# EAGLE design tranc_2b (EAGLE 6.5.0)
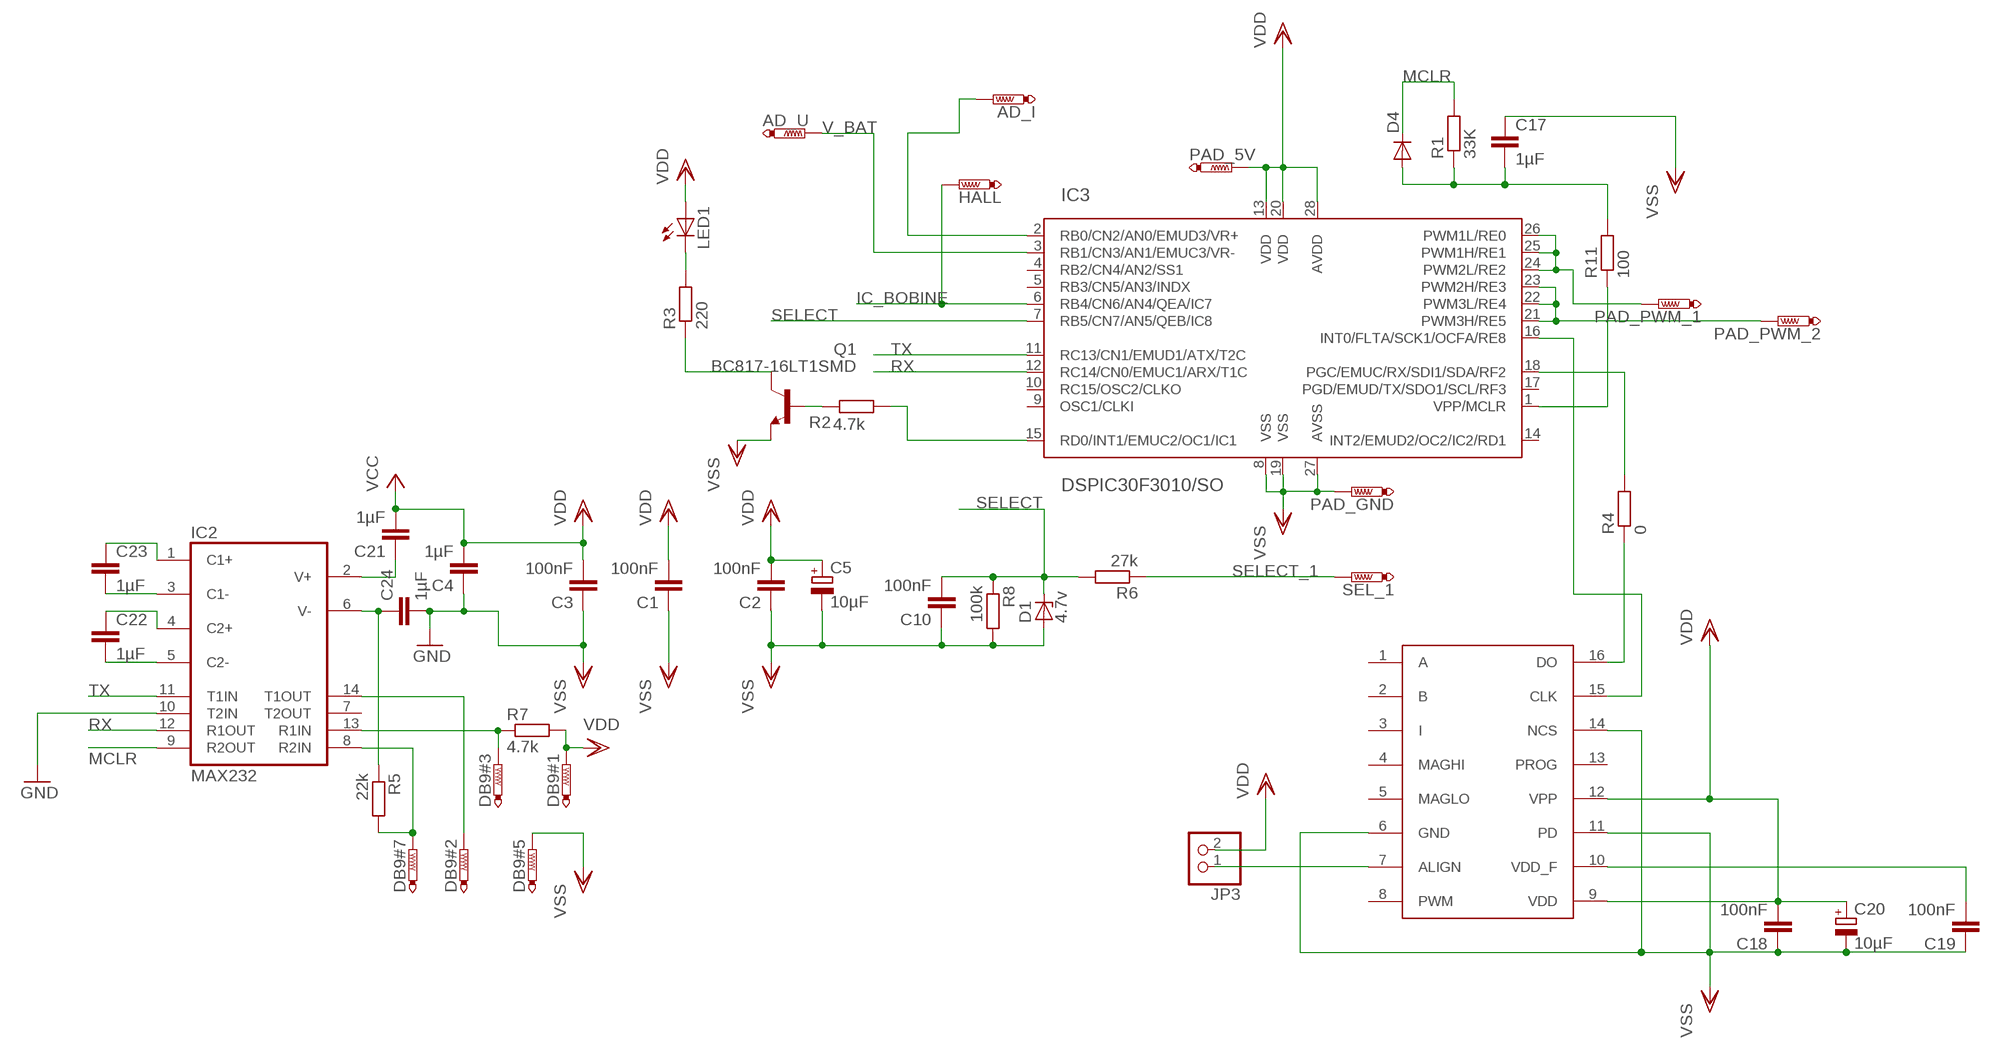
[diagram p0: schematic, sheet 1]

## Parts
AD_I  PTR1TP20SQ  [TP20SQ]
AD_U  PTR1TP20SQ  [TP20SQ]
C1  100nF  C-EUC0805K  [C0805K]
C2  100nF  C-EUC0805K  [C0805K]
C3  100nF  C-EUC0805K  [C0805K]
C4  1µF  C-EUC0805K  [C0805K]
C5  10µF  CPOL-EUSMCB  [SMC_B]
C10  100nF  C-EUC0805K  [C0805K]
C17  1µF  C-EUC0805K  [C0805K]
C18  100nF  C-EUC0805K  [C0805K]
C19  100nF  C-EUC0805K  [C0805K]
C20  10µF  CPOL-EUSMCB  [SMC_B]
C21  1µF  C-EUC0805K  [C0805K]
C22  1µF  C-EUC0805K  [C0805K]
C23  1µF  C-EUC0805K  [C0805K]
C24  1µF  C-EUC0805K  [C0805K]
D1  4.7v  ZENER-DIODESOD80C  [SOD80C]
D4  DIODE-MINIMELF  [MINIMELF]
DB9#1  PTR1TP20SQ  [TP20SQ]
DB9#2  PTR1TP20SQ  [TP20SQ]
DB9#3  PTR1TP20SQ  [TP20SQ]
DB9#5  PTR1TP20SQ  [TP20SQ]
DB9#7  PTR1TP20SQ  [TP20SQ]
HALL  PTR1TP20SQ  [TP20SQ]
IC2  MAX232  [SO16]
IC3  DSPIC30F3010/SO  [SO-28W]
JP3  PINHD-1X2  [1X02]
LED1  LEDCHIPLED_1206  [CHIPLED_1206]
PAD_5V  PTR1TP20SQ  [TP20SQ]
PAD_GND  PTR1TP20SQ  [TP20SQ]
PAD_PWM_1  PTR1TP20SQ  [TP20SQ]
PAD_PWM_2  PTR1TP20SQ  [TP20SQ]
Q1  BC817-16LT1SMD  [SOT23-BEC]
R1  33K  R-EU_M0805  [M0805]
R2  4.7k  R-EU_M0805  [M0805]
R3  220  R-EU_M0805  [M0805]
R4  0  R-EU_R0805W  [R0805W]
R5  22k  R-EU_M0805  [M0805]
R6  27k  R-EU_M0805  [M0805]
R7  4.7k  R-EU_M0805  [M0805]
R8  100k  R-EU_M0805  [M0805]
R11  100  R-EU_M0805  [M0805]
SEL_1  PTR1TP20SQ  [TP20SQ]
U$3  AVAGO_AEAT-6600TSSOP16  [AVAGO_TSSOP16]

## Nets
IC_BOBINE: HALL.TP IC3.6(RB4/CN6/AN4/QEA/IC7)
MCLR: D4.C IC2.9(R2OUT) R1.2
MCLR1: IC3.1(VPP/MCLR) R11.1
N$1: R4.1 U$3.16(DO)
N$2: IC3.24(PWM2L/RE2) IC3.25(PWM1H/RE1) IC3.26(PWM1L/RE0) PAD_PWM_1.TP
N$3: IC3.16(INT0/FLTA/SCK1/OCFA/RE8) U$3.15(CLK)
N$4: IC3.21(PWM3H/RE5) IC3.22(PWM3L/RE4) IC3.23(PWM2H/RE3) PAD_PWM_2.TP
N$5: Q1.B R2.2
N$6: Q1.C R3.1
N$7: IC3.15(RD0/INT1/EMUC2/OC1/IC1) R2.1
N$9: C17.2 D4.A R1.1 R11.2
N$10: C21.1 IC2.2(V+)
N$14: JP3.1 U$3.7(ALIGN)
N$17: IC3.18(PGC/EMUC/RX/SDI1/SDA/RF2) R4.2
N$23: LED1.C R3.2
N$27: C23.1 IC2.1(C1+)
N$28: C23.2 IC2.3(C1-)
N$29: C22.2 IC2.5(C2-)
N$30: AD_I.TP IC3.2(RB0/CN2/AN0/EMUD3/VR+)
N$31: C19.2 U$3.10(VDD_F)
N$32: C22.1 IC2.4(C2+)
N$34: C24.1 IC2.6(V-) R5.1
N$35: DB9#3.TP IC2.13(R1IN) R7.1
N$36: DB9#2.TP IC2.14(T1OUT)
N$37: DB9#7.TP IC2.8(R2IN) R5.2
RX: IC2.12(R1OUT) IC3.12(RC14/CN0/EMUC1/ARX/T1C)
SELECT: C10.2 D1.C IC3.7(RB5/CN7/AN5/QEB/IC8) R6.2 R8.1
SELECT_1: R6.1 SEL_1.TP
TX: IC2.11(T1IN) IC3.11(RC13/CN1/EMUD1/ATX/T2C)
V_BAT: AD_U.TP IC3.3(RB1/CN3/AN1/EMUC3/VR-)
VDD: C1.2 C2.2 C3.2 C4.2 C5.+ C18.2 C20.+ C21.2 DB9#1.TP IC3.13(VDD) IC3.20(VDD) IC3.28(AVDD) JP3.2 LED1.A PAD_5V.TP R7.2 U$3.9(VDD) U$3.12(VPP) ; supply symbol labelled VCC
VSS: C1.1 C2.1 C3.1 C4.1 C5.- C10.1 C17.1 C18.1 C19.1 C20.- C24.2 D1.A DB9#5.TP IC2.10(T2IN) IC3.8(VSS) IC3.19(VSS) IC3.27(AVSS) PAD_GND.TP Q1.E R8.2 U$3.6(GND) U$3.11(PD) U$3.14(NCS) ; supply symbol labelled GND
Unconnected: IC2.7(T2OUT) IC3.4(RB2/CN4/AN2/SS1) IC3.5(RB3/CN5/AN3/INDX) IC3.9(OSC1/CLKI) IC3.10(RC15/OSC2/CLKO) IC3.14(INT2/EMUD2/OC2/IC2/RD1) IC3.17(PGD/EMUD/TX/SDO1/SCL/RF3) U$3.1(A) U$3.2(B) U$3.3(I) U$3.4(MAGHI) U$3.5(MAGLO) U$3.8(PWM) U$3.13(PROG)

## Power pins joined to a net without a drawn wire
VDD: IC2.16(VCC)
VSS: IC2.15(GND)

## Library data of the parts
AD_I AD_U DB9#1-DB9#3 DB9#5 DB9#7 HALL PAD_5V PAD_GND PAD_PWM_1 PAD_PWM_2 SEL_1 = testpad:PTR1: TEST PIN
C1-C4 C10 C17-C19 C21-C24 = rcl:C-EU: CAPACITOR, European symbol
C5 C20 = rcl:CPOL-EU: POLARIZED CAPACITOR, European symbol
D1 = diode:ZENER-DIODE: Z-Diode
D4 = diode:DIODE-: DIODE
IC2 = maxim:MAX232: RS232 TRANSCEIVER
IC3 = microchip-dspic:DSPIC30F3010: dsPIC Motion Controller DSC
JP3 = pinhead:PINHD-1X2: PIN HEADER
LED1 = led:LED: LED OSRAM: - CHIPLED LG R971, LG N971, LY N971, LG Q971, LY Q971, LO R971, LY R971 LH N974, LH R974 LS Q976, LO Q976, LY Q976 LO Q996 - Hyper CHIPLED LW Q18S LB Q993, LB Q99A, LB R99A - SideLED LS A670, LO A670, LY A670, LG A670, LP A670 LB A673, LV A673, LT A673, LW A673 LH A674 LY A675 LS A676, LA A676, LO A676, LY A676, LW A676 LS A679, LY A679, LG A679 - Hyper Micro SIDELED® LS Y876, LA Y876, LO Y876, LY Y876 LT Y87S - SmartLED LW L88C, LW L88S LB L89C, LB L89S, LG L890 LS L89K, LO L89K, LY L89K LS L896, LA L896, LO L896, LY L896 - TOPLED LS T670, LO T670, LY T670, LG T670, LP T670 LSG T670, LSP T670, LSY T670, LOP T670, LYG T670 LG T671, LOG T671, LSG T671 LB T673, LV T673, LT T673, LW T673 LH T674 LS T676, LA T676, LO T676, LY T676, LB T676, LH T676, LSB T676, LW T676 LB T67C, LV T67C, LT T67C, LS T67K, LO T67K, LY T67K, LW E67C LS E67B, LA E67B, LO E67B, LY E67B, LB E67C, LV E67C, LT E67C LW T67C LS T679, LY T679, LG T679 LS T770, LO T770, LY T770, LG T770, LP T770 LB T773, LV T773, LT T773, LW T773 LH T774 LS E675, LA E675, LY E675, LS T675 LS T776, LA T776, LO T776, LY T776, LB T776 LHGB T686 LT T68C, LB T68C - Hyper Mini TOPLED® LB M676 - Mini TOPLED Santana® LG M470 LS M47K, LO M47K, LY M47K Source: http://www.osram.convergy.de LUXEON: - LUMILED® LXK2-PW12-R00, LXK2-PW12-S00, LXK2-PW14-U00, LXK2-PW14-V00 LXK2-PM12-R00, LXK2-PM12-S00, LXK2-PM14-U00 LXK2-PE12-Q00, LXK2-PE12-R00, LXK2-PE12-S00, LXK2-PE14-T00, LXK2-PE14-U00 LXK2-PB12-K00, LXK2-PB12-L00, LXK2-PB12-M00, LXK2-PB14-N00, LXK2-PB14-P00, LXK2-PB14-Q00 LXK2-PR12-L00, LXK2-PR12-M00, LXK2-PR14-Q00, LXK2-PR14-R00 LXK2-PD12-Q00, LXK2-PD12-R00, LXK2-PD12-S00 LXK2-PH12-R00, LXK2-PH12-S00 LXK2-PL12-P00, LXK2-PL12-Q00, LXK2-PL12-R00 Source: www.luxeon.com KINGBRIGHT: KA-3528ASYC Source: www.kingbright.com
Q1 = transistor-npn:BC817*: NPN Transistor
R1-R8 R11 = rcl:R-EU_: RESISTOR, European symbol
U$3 = aeat_6600_1:AVAGO_AEAT-6600

## Board
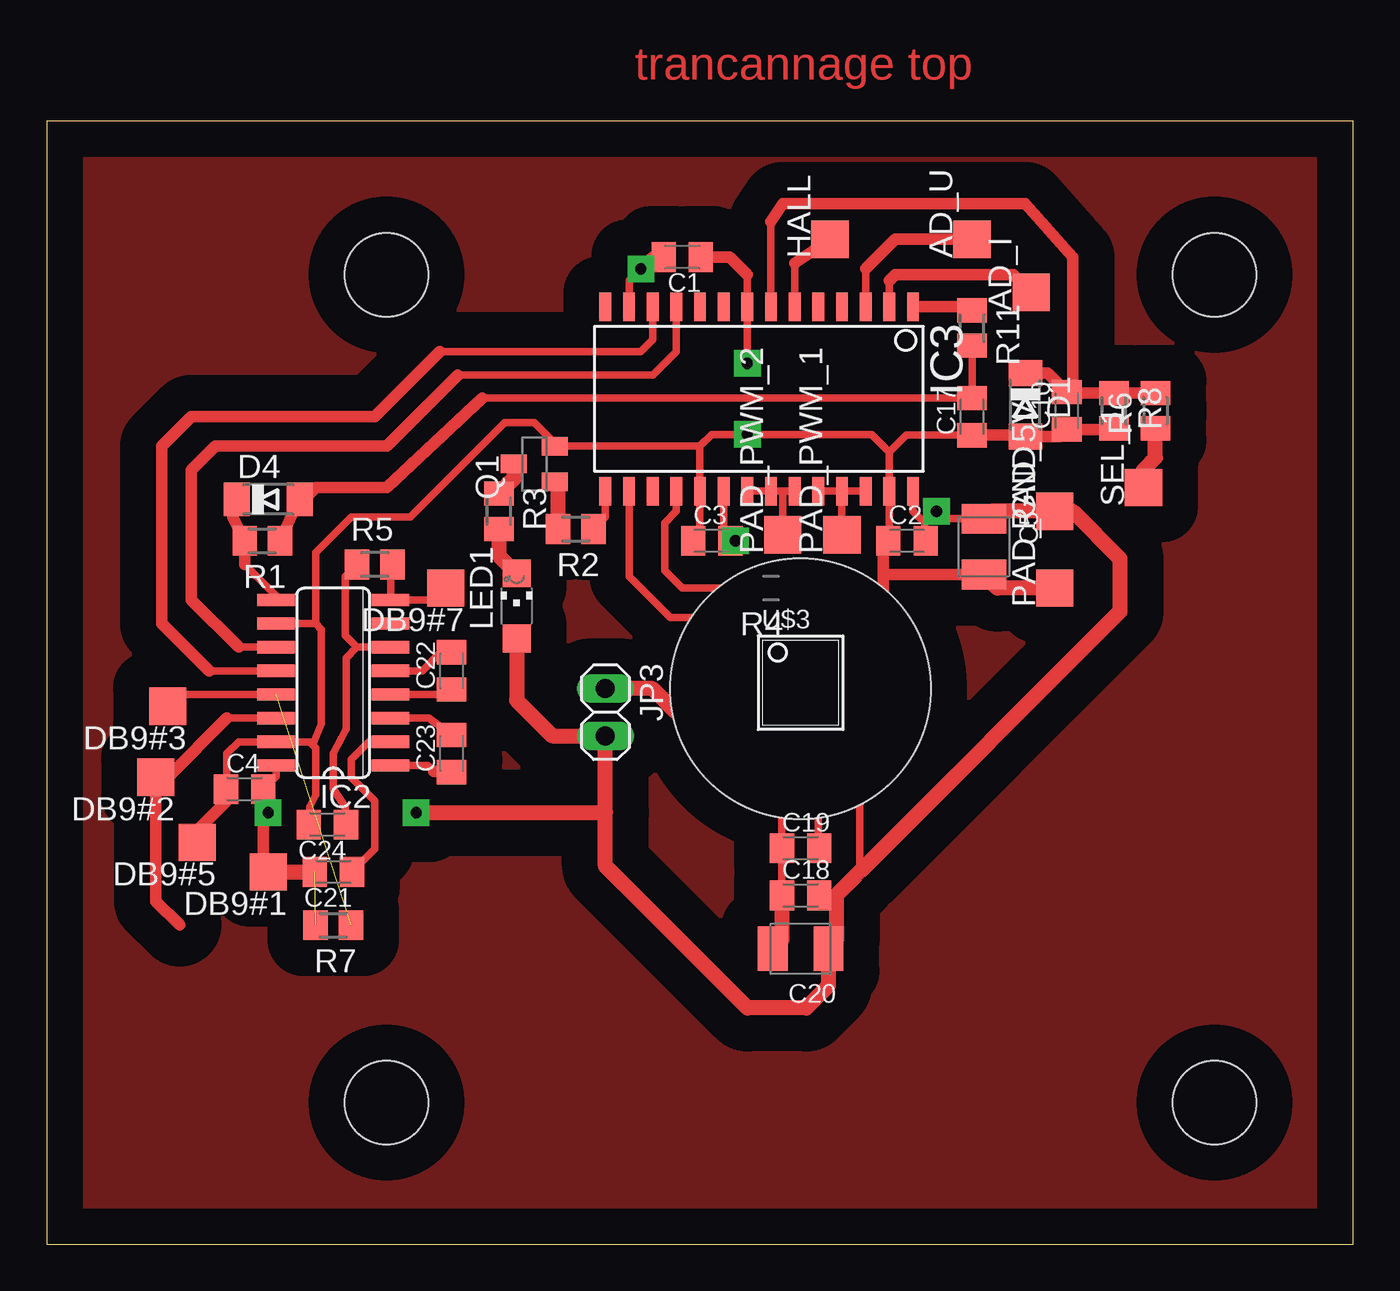
[diagram p1: board, top side]
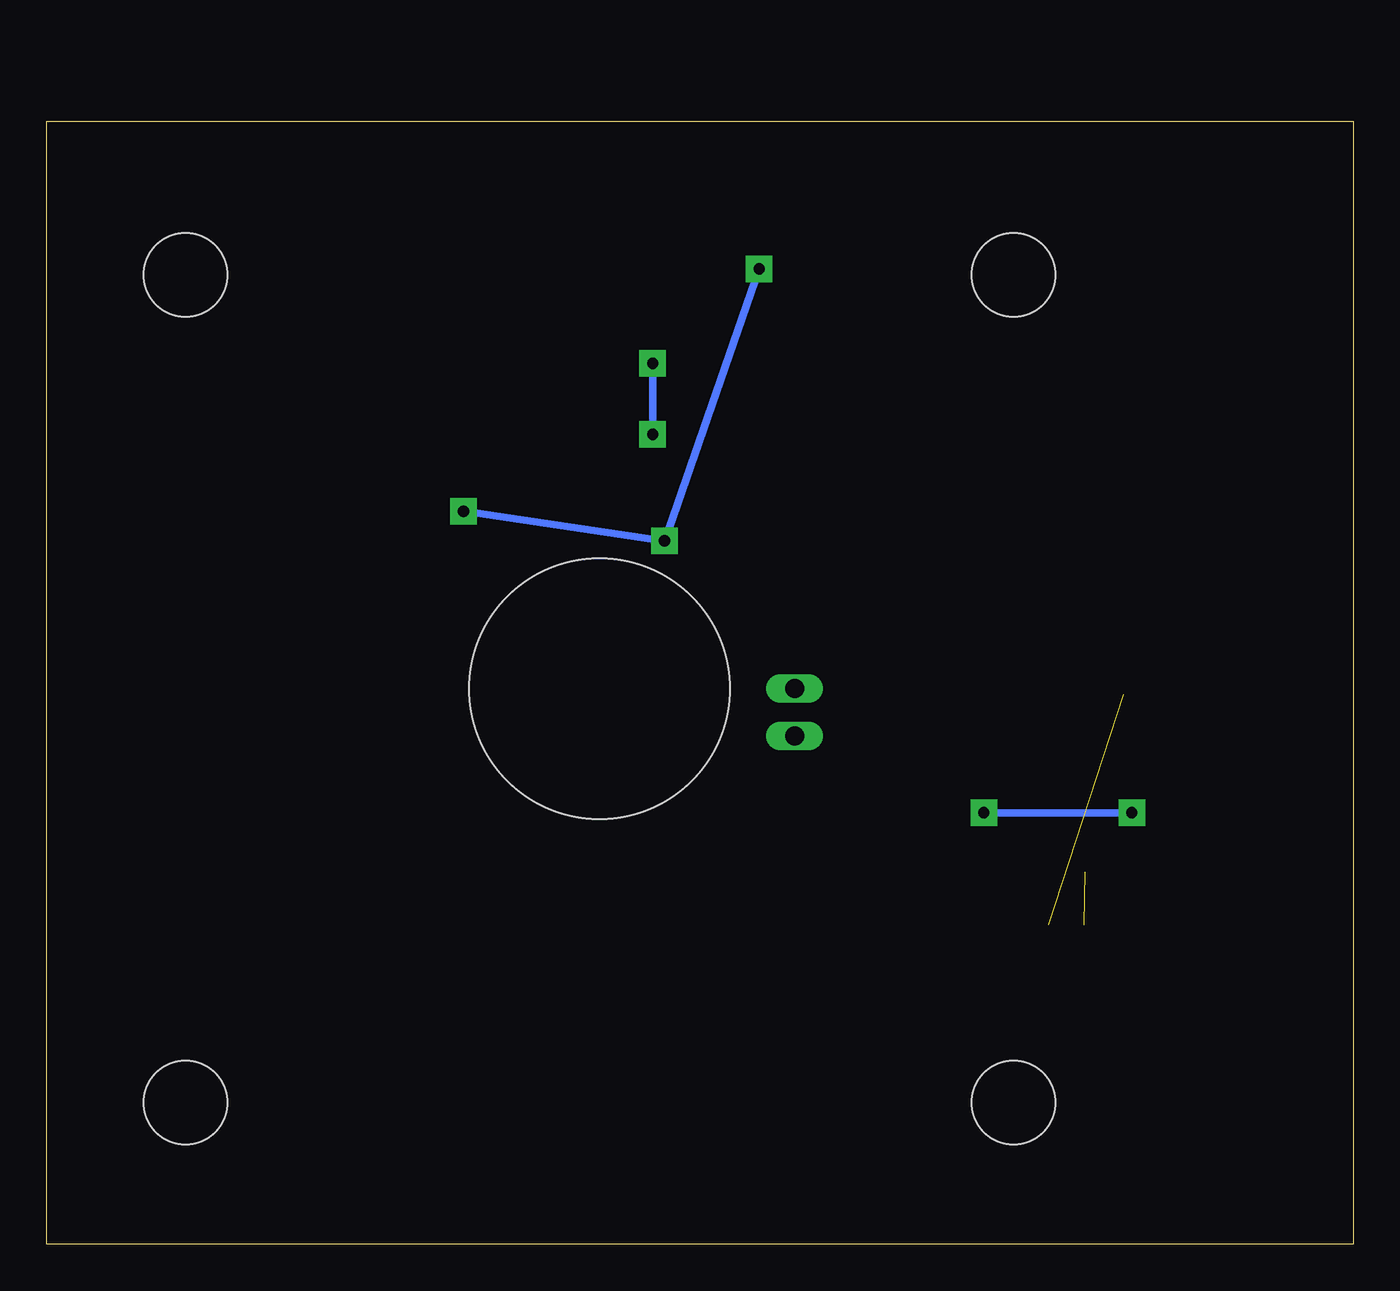
[diagram p2: board, bottom side, seen from below]

Size 70.16 x 60.31 mm. Coordinates in mm from the lower left corner, seen from the top.
Outline: 0,0 70.16,0 70.16,60.31 0,60.31 0,0
Copper layers (1*16): Top 0.035mm / dielectric 1.5mm / Bottom 0.035mm
Design rules "default": minimum track width 10mil, minimum drill 24mil, track to track 8mil, track to pad 8mil, pad to pad 8mil, via to via 8mil, smd to smd 8mil, copper to edge 40mil, drill to drill 8mil, minimum pad ring 10mil, minimum via ring 8mil, stop-mask expansion 4mil, vias tented up to drill 0mil, thermal gap 10mil
Holes 14 mm at 40.48,29.84
Holes 4.5 mm at 18.25,52.06 62.7,52.06 18.25,7.62 62.7,7.62

### Footprints (pad centres in the part's own frame; a part is rotated, then mirrored left to right if it is on the bottom)
TP20SQ = smd 2 x 2: TP 0,0
C0805K = smd 1.3 x 1.6: 1 -1,0; 2 1,0
SMC_B = smd 1.6 x 2.4: + -1.5,0; - 1.5,0
SOD80C = smd 1.4 x 1.8: A 1.7,0; C -1.7,0
MINIMELF = smd 1.4 x 1.8: A 1.7,0; C -1.7,0
SO16 = smd 0.66 x 2.032: 1 -4.445,-3.073; 2 -3.175,-3.073; 3 -1.905,-3.073; 4 -0.635,-3.073; 5 0.635,-3.073; 6 1.905,-3.073; 7 3.175,-3.073; 8 4.445,-3.073; 9 4.445,3.073; 10 3.175,3.073; 11 1.905,3.073; 12 0.635,3.073; 13 -0.635,3.073; 14 -1.905,3.073; 15 -3.175,3.073; 16 -4.445,3.073
SO-28W = smd 0.635 x 1.524: 1 -7.62,-4.953; 2 -6.35,-4.953; 3 -5.08,-4.953; 4 -3.81,-4.953; 5 -2.54,-4.953; 6 -1.27,-4.953; 7 0,-4.953; 8 1.27,-4.953; 9 2.54,-4.953; 10 3.81,-4.953; 11 5.08,-4.953; 12 6.35,-4.953; 13 7.62,-4.953; 14 8.89,-4.953; 15 8.89,4.953; 16 7.62,4.953; 17 6.35,4.953; 18 5.08,4.953; 19 3.81,4.953; 20 2.54,4.953; 21 1.27,4.953; 22 0,4.953; 23 -1.27,4.953; 24 -2.54,4.953; 25 -3.81,4.953; 26 -5.08,4.953; 27 -6.35,4.953; 28 -7.62,4.953
1X02 = drill 1.016 long: 1 -1.27,0; 2 1.27,0
CHIPLED_1206 = smd 1.5 x 1.5: A 0,-1.75; C 0,1.75
SOT23-BEC = smd 1 x 1.4: B -0.95,-1.1; C 0,1.1; E 0.95,-1.1
M0805 = smd 1.3 x 1.6: 1 -0.95,0; 2 0.95,0
R0805W = smd 1.5 x 1: 1 -1.052,0; 2 1.052,0
AVAGO_TSSOP16 = smd 0.305 x 0.991: 1 -2.275,-2.918; 2 -1.625,-2.918; 3 -0.975,-2.918; 4 -0.325,-2.918; 5 0.325,-2.918; 6 0.975,-2.918; 7 1.625,-2.918; 8 2.275,-2.918; 9 2.275,2.918; 10 1.625,2.918; 11 0.975,2.918; 12 0.325,2.918; 13 -0.325,2.918; 14 -0.975,2.918; 15 -1.625,2.918; 16 -2.275,2.918

### Placement (x,y rotation side)
AD_I  52.86,51.11 90 top
AD_U  49.68,53.97 90 top
C1  34.12,53.02 180 top
C2  46.19,37.78 0 top
C3  35.71,37.78 0 top
C4  10.63,24.44 0 top
C5  50.32,37.46 270 top
C10  54.76,44.76 90 top
C17  49.68,44.45 90 top
C18  40.48,18.73 0 top
C19  40.48,21.27 0 top
C20  40.48,15.87 180 top
C21  15.39,20 180 top
C22  21.74,30.79 90 top
C23  21.74,26.35 90 top
C24  15.08,22.54 180 top
D1  52.54,45.08 270 top
D4  11.9,40 0 top
DB9#1  11.9,20 180 top
DB9#2  5.87,25.08 180 top
DB9#3  6.5,28.89 180 top
DB9#5  8.09,21.59 180 top
DB9#7  21.42,35.24 180 top
HALL  42.06,53.97 90 top
IC2  15.39,30.16 90 top
IC3  38.89,45.4 180 top
JP3  30,28.57 270 top
LED1  25.23,34.28 0 top
PAD_5V  54.13,39.36 90 top
PAD_GND  54.13,35.24 90 top
PAD_PWM_1  42.7,38.09 90 top
PAD_PWM_2  39.52,38.09 90 top
Q1  26.19,41.9 90 top
R1  11.58,37.78 180 top
R2  28.41,38.41 180 top
R3  24.28,39.36 270 top
R4  38.89,35.24 180 top
R5  17.61,36.51 0 top
R6  59.52,44.76 90 top
R7  15.39,17.14 180 top
R8  57.3,44.76 270 top
R11  49.68,49.21 270 top
SEL_1  58.89,40.63 90 top
U$3  40.48,30.16 270 top

### Tracks (layer width: path | path; a pad name or v marks a point on that pad's centre or on a via)
IC_BOBINE
  Top 0.406: IC3.6 40.16,52.7
  Top 0.61: 40.16,52.7 HALL.TP
MCLR
  Top 0.406: 10,39.05 10,40 10,39.79 D4.C | IC2.9 12.32,34.82 10.63,36.51 | R1.2
  Top 0.61: R1.2 10,39.05 | 10.63,36.51 R1.2
MCLR1
  Top 0.406: 49.49,50.35 R11.1
  Top 0.61: IC3.1 49.49,50.35
N$1
  Top 0.406: R4.1 40.59,35.24 U$3.16
N$2
  Top 0.406: IC3.24 IC3.25 | IC3.26 IC3.25 | PAD_PWM_1.TP IC3.25
N$3
  Top 0.254: U$3.15 41.07,31.78 40.79,32.06
  Top 0.406: 40.79,32.06 39.2,33.65 33.49,33.65 31.27,35.87 IC3.16
N$4
  Top 0.406: IC3.21 IC3.22 39.52,40.45 | 39.52,40.45 IC3.23 | PAD_PWM_2.TP 39.52,40.45
N$5
  Top 0.406: 27.46,40.78 Q1.B
  Top 0.813: R2.2 27.46,40.78
N$6
  Top 0.813: Q1.C 25.09,41.12 R3.1
N$7
  Top 0.406: IC3.15 30,39.05 R2.1
N$8
  pour Top (isolate 1.93): 0.15,60 69.69,60 69.69,0.31 0.15,0.31
N$9
  Top 0.406: R11.2 C17.2 23.38,45.45 | 12.58,37.83 R1.1 | 13.17,39.16 D4.A 13.81,40
  Top 0.61: R1.1 13.17,39.16 | 23.38,45.45 18.25,40.63 14.44,40.63 13.81,40
N$10
  Top 0.406: IC2.2 17.3,26.98 16.34,26.03 16.34,25.08 17.61,23.81 17.61,21.22 C21.1
N$14
  Top 0.254: U$3.7 35.43,28.53 35.39,28.57
  Top 0.406: 35.39,28.57 33.81,28.57
  Top 0.813: 33.81,28.57 32.54,29.84 JP3.1
N$17
  Top 0.406: R4.2 34.12,35.24 33.17,36.19 33.17,38.73 33.81,39.36 IC3.18
N$23
  Top 0.813: R3.2 24.28,36.99 LED1.C
N$27
  Top 0.406: IC2.1 20.47,25.71 20.79,25.39 | 22.01,25.39 C23.1
  Top 0.61: 20.79,25.39 22.01,25.39
N$28
  Top 0.406: IC2.3 20.52,28.25 C23.2
N$29
  Top 0.406: IC2.5 20.15,30.79 21.11,31.75 22.01,31.75 C22.2
N$30
  Top 0.406: IC3.2 45.24,51.75
  Top 0.61: 45.24,51.75 45.55,52.06 51.91,52.06 AD_I.TP
N$31
  Top 0.254: U$3.10 42.34,28.53 41.43,27.62
  Top 0.406: 41.43,27.62 41.43,21.32 C19.2
N$32
  Top 0.406: IC2.4 22.06,29.52 C22.1
N$34
  Top 0.406: C24.1 16.03,23.49 15.39,24.44 15.39,26.35 16.07,27.67 16.07,31.48 16.66,32.06 | 16.66,32.06 IC2.6 | R5.1 16.03,35.87 16.03,32.7 16.66,32.06
N$35  (1 unrouted)
  Top 0.406: IC2.13 7.14,29.52 DB9#3.TP
N$36
  Top 0.406: IC2.14 9.68,28.25 | 6.5,25.08 DB9#2.TP
  Top 0.61: 9.68,28.25 6.5,25.08 | 7.14,17.14 5.87,18.41 DB9#2.TP
N$37
  Top 0.406: R5.2 18.47,36.73 IC2.8 21.42,34.6 DB9#7.TP
RX
  Top 0.406: IC2.12 8.73,30.79 | 21.11,47.94 31.9,47.94 32.54,48.57 IC3.12
  Top 0.61: 8.73,30.79 6.18,33.33 6.18,42.86 7.77,44.45 17.61,44.45 21.11,47.94
SELECT
  Top 0.406: C10.2 54.81,45.71 55.4,45.71 55.08,46.03 | IC3.7 38.89,54.92
  Top 0.61: R6.2 R8.1 55.4,45.71 | D1.C 53.74,46.78 C10.2 | 38.89,54.92 39.52,55.88 52.54,55.88 55.08,53.02 55.08,46.03
SELECT_1
  Top 0.406: SEL_1.TP 58.89,41.59
  Top 0.813: 58.89,41.59 59.52,42.22 R6.1
TX
  Top 0.406: IC3.11 33.81,47.94 32.54,46.67 22.06,46.67 | 10.31,32.06 IC2.11
  Top 0.61: 22.06,46.67 18.25,42.86 9.04,42.86 7.77,41.59 7.77,34.6 10.31,32.06
V_BAT
  Top 0.406: IC3.3 43.97,52.38
  Top 0.61: 43.97,52.38 45.55,53.97 AD_U.TP
VDD  (via drill 0.6 pad 1.42)  (1 unrouted)
  Top 0.254: U$3.9 43.97,27.88 44.55,27.88 44.92,28.25 44.92,29.52 44.6,29.84 U$3.12
  Top 0.406: IC2.16 12.32,25.13 C4.2 11.63,23.49 11.95,23.17 v11.9,23.17 | 11.63,20.27 DB9#1.TP | C18.2 42.38,18.73 | 43.49,19.84 43.65,20 43.65,27.57 43.97,27.88 | IC3.20 36.35,38.14 C3.2 v36.98,37.78 | 42.38,16.28 C20.+ | 32.54,53.02 C1.2 | 50.72,39.36 C5.+ 47.78,38.96 | IC3.13 31.27,51.75 v31.9,52.38 | IC3.28 46.51,39.36 47.14,38.73 | 47.14,38.73 47.14,37.82 C2.2 | 47.78,38.96 47.37,38.96 47.14,38.73 | v47.78,39.36 47.78,38.96 | PAD_5V.TP 55.08,39.36
  Top 0.61: 11.63,23.49 11.63,20.27 | v31.9,52.38 32.54,53.02
  Top 0.813: DB9#1.TP C21.2 | 43.49,19.84 42.38,18.73 42.38,16.28 | LED1.A 25.23,29.21 27.14,27.3 JP3.2 30,23.17 | PAD_5V.TP 50.72,39.36 | C20.+ 41.98,13.88 40.79,12.69 37.62,12.69 30,20.32 30,23.17 | 30,23.17 v19.84,23.17 | 55.08,39.36 57.62,36.82 57.62,33.97 43.65,20
  Bottom 0.406: v19.84,23.17 v11.9,23.17 | v31.9,52.38 v36.98,37.78 v47.78,39.36
VSS  (via drill 0.6 pad 1.42)
  Top 0.254: U$3.11 41.43,29.18 | 41.43,29.18 39.84,29.18 U$3.6 | 41.43,29.18 41.43,30.48 42.09,31.13 U$3.14 44.62,31.13 44.92,31.43
  Top 0.406: 9.63,23.76 C4.1 9.68,24.49 9.68,26.35 10.31,26.98 IC2.15 14.12,26.98 14.28,26.82 | 7.46,21.59 DB9#5.TP | 14.28,26.82 14.44,26.67 14.44,24.12 14.12,23.49 14.12,22.59 C24.2 | IC2.10 14.44,33.33 | 14.28,26.82 14.76,27.94 14.76,33.02 14.44,33.33 | 39.84,29.18 39.48,28.82 C19.1 C18.1 | C3.1 35.08,38.14 IC3.19 35.08,42.86 | C17.1 46.14,43.45 45.24,42.54 | 45.24,42.54 IC3.27 45.24,37.82 C2.1 44.92,37.51 | 35.08,42.86 35.71,43.49 v37.62,43.49 44.28,43.49 45.24,42.54 | 39.48,16.37 C20.- | 35.08,42.86 35.07,42.85 Q1.E 27.29,43.03 26.19,44.13 24.6,44.13 19.52,39.05 16.34,39.05 14.44,37.14 14.44,33.33 | 37.62,52.06 IC3.8 v37.62,47.3 | 52.48,43.45 D1.A | 54.38,43.38 C10.1 | 57.25,43.76 R8.2 | 45.15,35.96 44.92,36.19
  Top 0.61: 9.63,23.76 7.46,21.59 | 44.92,31.43 44.92,36.19 44.92,37.51 | 37.62,52.06 36.66,53.02 C1.1 | C17.1 52.48,43.45 | D1.A 54.38,43.38 | C10.1 57.25,43.76 | C5.- 45.15,35.96
  Top 0.813: C18.1 39.48,16.37 | PAD_GND.TP 51.04,35.24 C5.-
  Bottom 0.406: v37.62,43.49 v37.62,47.3

### Text on the board
Top: trancannage top